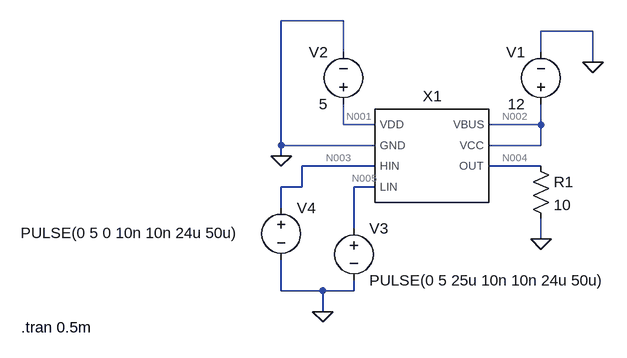
[diagram p0: schematic Draft1.asc]
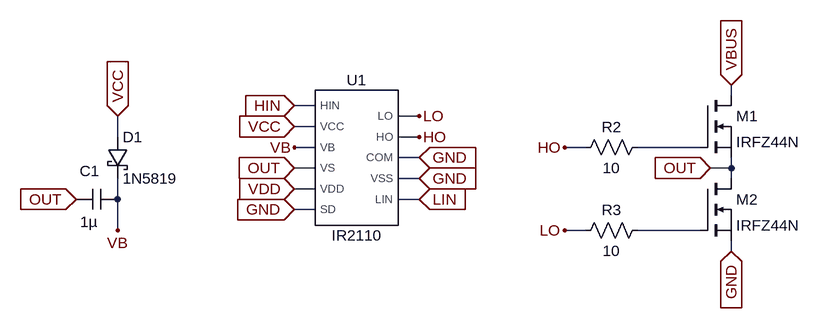
[diagram p1: sub-circuit half-bridge.asc]
Draft1.asc, the LTspice schematic file:
Version 4.1
SHEET 1 880 680
WIRE 32 -64 -64 -64
WIRE 416 -48 336 -48
WIRE 32 -16 32 -64
WIRE 336 -16 336 -48
WIRE 416 0 416 -48
WIRE 32 96 32 64
WIRE 80 96 32 96
WIRE 336 96 336 64
WIRE 336 96 256 96
WIRE -64 128 -64 -64
WIRE 80 128 -64 128
WIRE 336 128 336 96
WIRE 336 128 256 128
WIRE -64 144 -64 128
WIRE 80 160 -32 160
WIRE 336 160 256 160
WIRE -32 192 -32 160
WIRE -32 192 -64 192
WIRE 80 192 48 192
WIRE -64 224 -64 192
WIRE 48 256 48 192
WIRE 336 272 336 240
WIRE -64 352 -64 304
WIRE 0 352 -64 352
WIRE 48 352 48 336
WIRE 48 352 0 352
WIRE 0 384 0 352
FLAG 416 0 0
FLAG 336 272 0
FLAG -64 144 0
FLAG 0 384 0
SYMBOL half-bridge 176 160 R0
SYMATTR InstName X1
SYMBOL voltage 336 80 R180
WINDOW 0 24 96 Left 2
WINDOW 3 24 16 Left 2
WINDOW 123 0 0 Left 0
WINDOW 39 0 0 Left 0
SYMATTR InstName V1
SYMATTR Value 12
SYMBOL res 320 144 R0
SYMATTR InstName R1
SYMATTR Value 10
SYMBOL voltage 32 80 R180
WINDOW 0 24 96 Left 2
WINDOW 3 24 16 Left 2
WINDOW 123 0 0 Left 0
WINDOW 39 0 0 Left 0
SYMATTR InstName V2
SYMATTR Value 5
SYMBOL voltage 48 240 R0
WINDOW 123 0 0 Left 0
WINDOW 39 0 0 Left 0
SYMATTR InstName V3
SYMATTR Value PULSE(0 5 25u 10n 10n 24u 50u)
SYMBOL voltage -64 208 R0
WINDOW 3 -401 55 Left 2
WINDOW 123 0 0 Left 0
WINDOW 39 0 0 Left 0
SYMATTR InstName V4
SYMATTR Value PULSE(0 5 0 10n 10n 24u 50u)
TEXT -464 408 Left 2 !.tran 0.5m

half-bridge.asc, the sub-circuit schematic file:
Version 4.1
SHEET 1 1748 680
WIRE 1392 -560 1392 -576
WIRE 752 -544 720 -544
WIRE 912 -528 880 -528
WIRE 752 -512 720 -512
WIRE 448 -496 448 -528
WIRE 912 -496 880 -496
WIRE 752 -480 720 -480
WIRE 1168 -480 1136 -480
WIRE 1344 -480 1248 -480
WIRE 912 -464 880 -464
WIRE 752 -448 720 -448
WIRE 1392 -448 1392 -464
WIRE 1392 -448 1360 -448
WIRE 912 -432 880 -432
WIRE 1392 -432 1392 -448
WIRE 752 -416 720 -416
WIRE 448 -400 448 -432
WIRE 912 -400 880 -400
WIRE 752 -384 720 -384
WIRE 448 -352 448 -400
WIRE 1168 -352 1136 -352
WIRE 1344 -352 1248 -352
WIRE 1392 -320 1392 -336
FLAG 720 -512 VCC
IOPIN 720 -512 In
FLAG 912 -496 HO
FLAG 912 -528 LO
FLAG 720 -544 HIN
IOPIN 720 -544 In
FLAG 912 -400 LIN
IOPIN 912 -400 In
FLAG 1392 -320 GND
IOPIN 1392 -320 In
FLAG 1392 -576 VBUS
IOPIN 1392 -576 In
FLAG 1136 -352 LO
FLAG 1136 -480 HO
FLAG 720 -416 VDD
IOPIN 720 -416 In
FLAG 1360 -448 OUT
IOPIN 1360 -448 In
FLAG 720 -448 OUT
IOPIN 720 -448 In
FLAG 720 -480 VB
FLAG 448 -528 VCC
IOPIN 448 -528 In
FLAG 448 -352 VB
FLAG 384 -400 OUT
IOPIN 384 -400 In
FLAG 720 -384 GND
IOPIN 720 -384 In
FLAG 912 -464 GND
IOPIN 912 -464 In
FLAG 912 -432 GND
IOPIN 912 -432 In
SYMBOL IR2110 816 -464 M0
SYMATTR InstName U1
SYMBOL nmos 1344 -560 R0
SYMATTR InstName M1
SYMATTR Value IRFZ44N
SYMBOL nmos 1344 -432 R0
SYMATTR InstName M2
SYMATTR Value IRFZ44N
SYMBOL res 1264 -496 R90
WINDOW 0 0 56 VBottom 2
WINDOW 3 32 56 VTop 2
SYMATTR InstName R2
SYMATTR Value 10
SYMBOL res 1264 -368 R90
WINDOW 0 0 56 VBottom 2
WINDOW 3 32 56 VTop 2
SYMATTR InstName R3
SYMATTR Value 10
SYMBOL schottky 432 -496 R0
SYMATTR InstName D1
SYMATTR Value 1N5819
SYMATTR Description Diode
SYMATTR Type diode
SYMBOL cap 448 -416 R90
WINDOW 0 -12 43 VBottom 2
WINDOW 3 35 44 VTop 2
SYMATTR InstName C1
SYMATTR Value 1µ

The netlist it stands for:
* Draft1.asc
X§X1 0 N003 N005 N004 N002 N002 N001 half-bridge
V1 N002 0 12
R1 N004 0 10
V2 N001 0 5
V3 N005 0 PULSE(0 5 25u 10n 10n 24u 50u)
V4 N003 0 PULSE(0 5 0 10n 10n 24u 50u)

* block symbol definitions
.subckt half-bridge GND HIN LIN OUT VBUS VCC VDD
X§U1 LO HO GND GND LIN HIN VCC VB OUT VDD GND IR2110  ; pins LO HO COM VSS LIN HIN VCC VB VS VDD SD
M1 VBUS N001 OUT OUT IRFZ44N
M2 OUT N002 GND GND IRFZ44N
R2 N001 HO 10
R3 N002 LO 10
D1 VCC VB 1N5819
C1 VB OUT 1µ
.ends half-bridge

.model D D
.lib standard.dio
.model NMOS NMOS
.model PMOS PMOS
.lib standard.mos
.tran 0.5m
.lib IR2110.lib
.backanno
.end

* Results of the author's LTspice run, read from the files saved beside the schematic
* Operating Point, zero values left out:
*   V(n001) = 5 V
*   V(n002) = 12 V
*   V(n004) = 943.8 µV
*   I(R1) = 94.38 µA
*   I(V1) = -226.4 µA
*   I(V2) = -16 µA
*   I(V3) = 12 pA
*   I(V4) = 12 pA
*   Ix(x1:hin) = -12 pA
*   Ix(x1:lin) = -12 pA
*   Ix(x1:out) = -94.38 µA
*   Ix(x1:vbus) = 13.58 pA
*   Ix(x1:vcc) = 226.4 µA
*   Ix(x1:vdd) = 16 µA
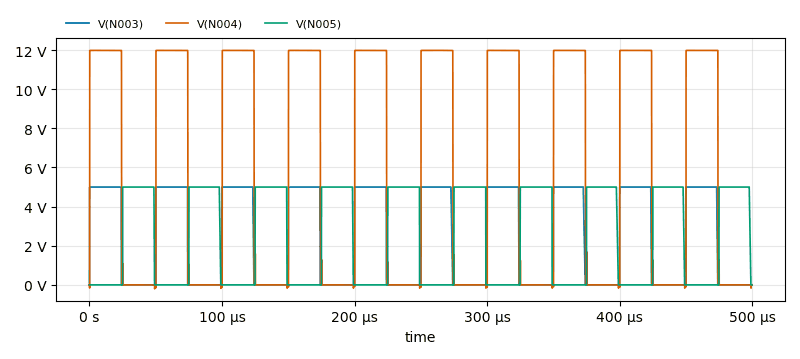
[diagram p2: Transient Analysis of Draft1.asc, plotted from the saved traces]
* Transient Analysis, 1 run:
*   V(N003): min 0 V, max 5 V, average 2.401 V, rms 3.465 V, last 0 V
*   V(N004): min -201.1 mV, max 11.99 V, average 5.769 V, rms 8.312 V, last 7.123 mV
*   V(N005): min 0 V, max 5 V, average 2.401 V, rms 3.465 V, last 0 V